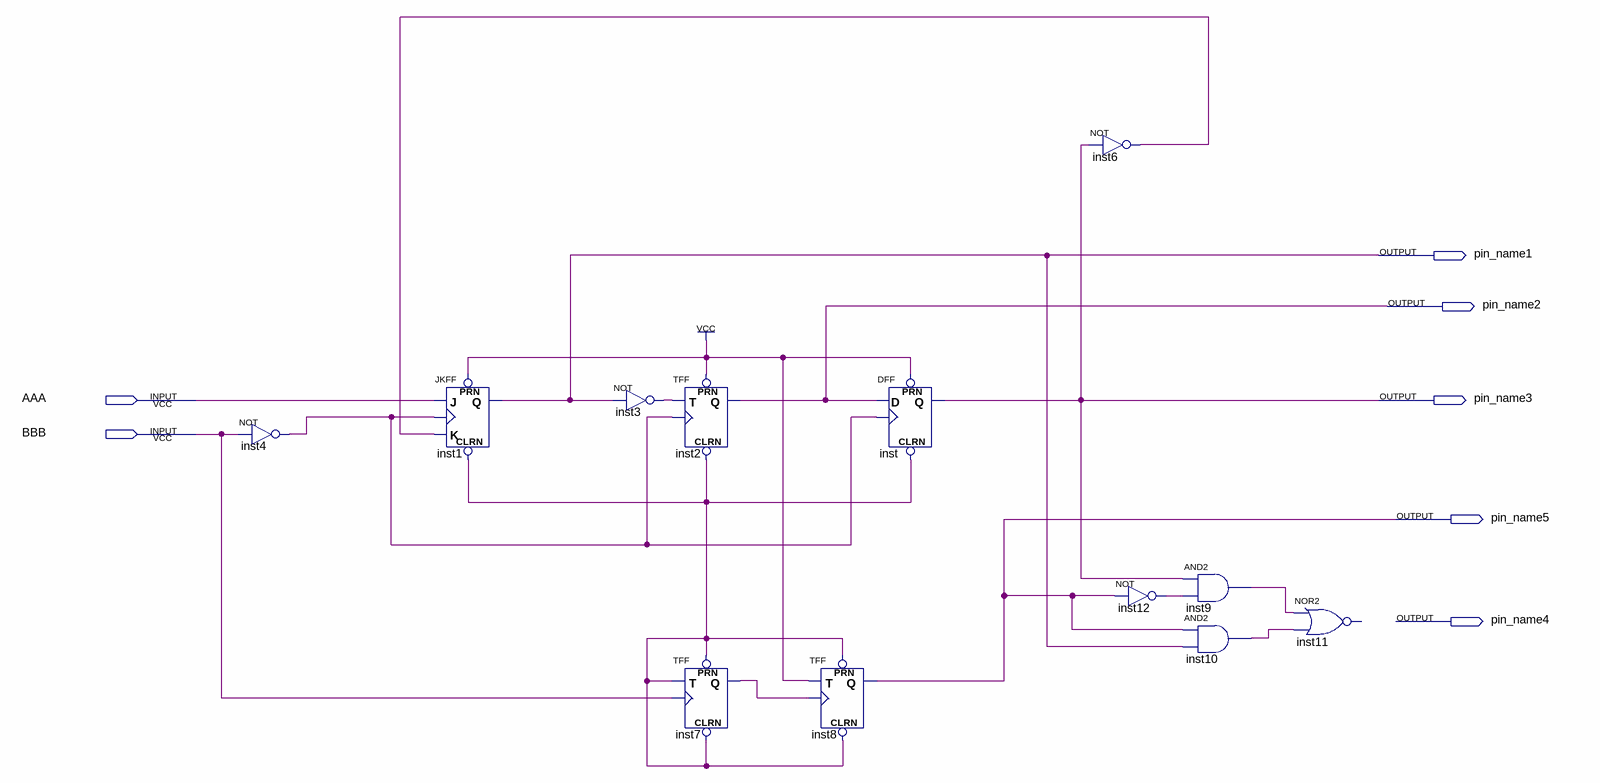
[diagram p0: schematic sheet]
// Quartus schematic prova2.bdf as structural Verilog: 12 symbols, 7 pins
module prova2 (
  input  AAA,
  input  BBB,
  output pin_name1,
  output pin_name2,
  output pin_name3,
  output pin_name5,
  output pin_name4
);

  wire inst3_out, inst4_out, inst6_out, inst7_q, inst9_out, inst10_out, inst12_out, undriven;

  not inst4 (inst4_out, BBB);
  JKFF inst1 (.PRN(1'b1), .CLRN(undriven), .K(inst6_out), .J(AAA), .CLK(inst4_out), .Q(pin_name1));
  not inst3 (inst3_out, pin_name1);
  TFF inst2 (.PRN(1'b1), .CLRN(undriven), .T(inst3_out), .CLK(inst4_out), .Q(pin_name2));
  TFF inst7 (.PRN(undriven), .CLRN(undriven), .T(undriven), .CLK(BBB), .Q(inst7_q));
  TFF inst8 (.PRN(undriven), .CLRN(undriven), .T(1'b1), .CLK(inst7_q), .Q(pin_name5));
  DFF inst (.CLRN(undriven), .CLK(inst4_out), .D(pin_name2), .PRN(1'b1), .Q(pin_name3));
  not inst6 (inst6_out, pin_name3);
  not inst12 (inst12_out, pin_name5);
  and inst9 (inst9_out, pin_name3, inst12_out);
  and inst10 (inst10_out, pin_name5, pin_name1);
  // NOR2 inst11 has open pins: IN1=inst9_out, IN2=inst10_out, OUT=open
endmodule
